# Altium schematic sheet MAIN.SchDoc
size 420 x 297 mm; SheetNumber: 1; SheetTotal: 3; SPICEModelCacheFXBRRBJG: <root> / <DocumentId>FXBRRBJG</DocumentId> / <CacheFrame Number="0"> / <Model Name="my_lib_c_rc" Kind="CKT"> / <Text>* MY_LIB YAGEO CC X7R: nominal capacitance, DFmax-derived Rs, minimum insulation. / * Source: YAGEO CC X7R March 6 2026 V.27 pp14-15,20. / * Rs=DFmax/(2*pi*1000*Cnom); Rins=min(1e10,K/Cnom). / * Constant Rs is justified at 1kHz only. Leakage adds a small extra AC loss. / * No tolerance, temperature, DC bias, ESL, aging, absorption or breakdown. / .SUBCKT MY_LIB_C_RC 1 2 PARAMS: Cvalue=1n Rsvalue=1 Rinsvalue=1e10 / Rloss 1 3 {Rsvalue} / Cmain 3 2 {Cvalue} / Rleak 1 2 {Rinsvalue} / .ENDS MY_LIB_C_RC</Text> / </Model> / </CacheFrame> / </root>
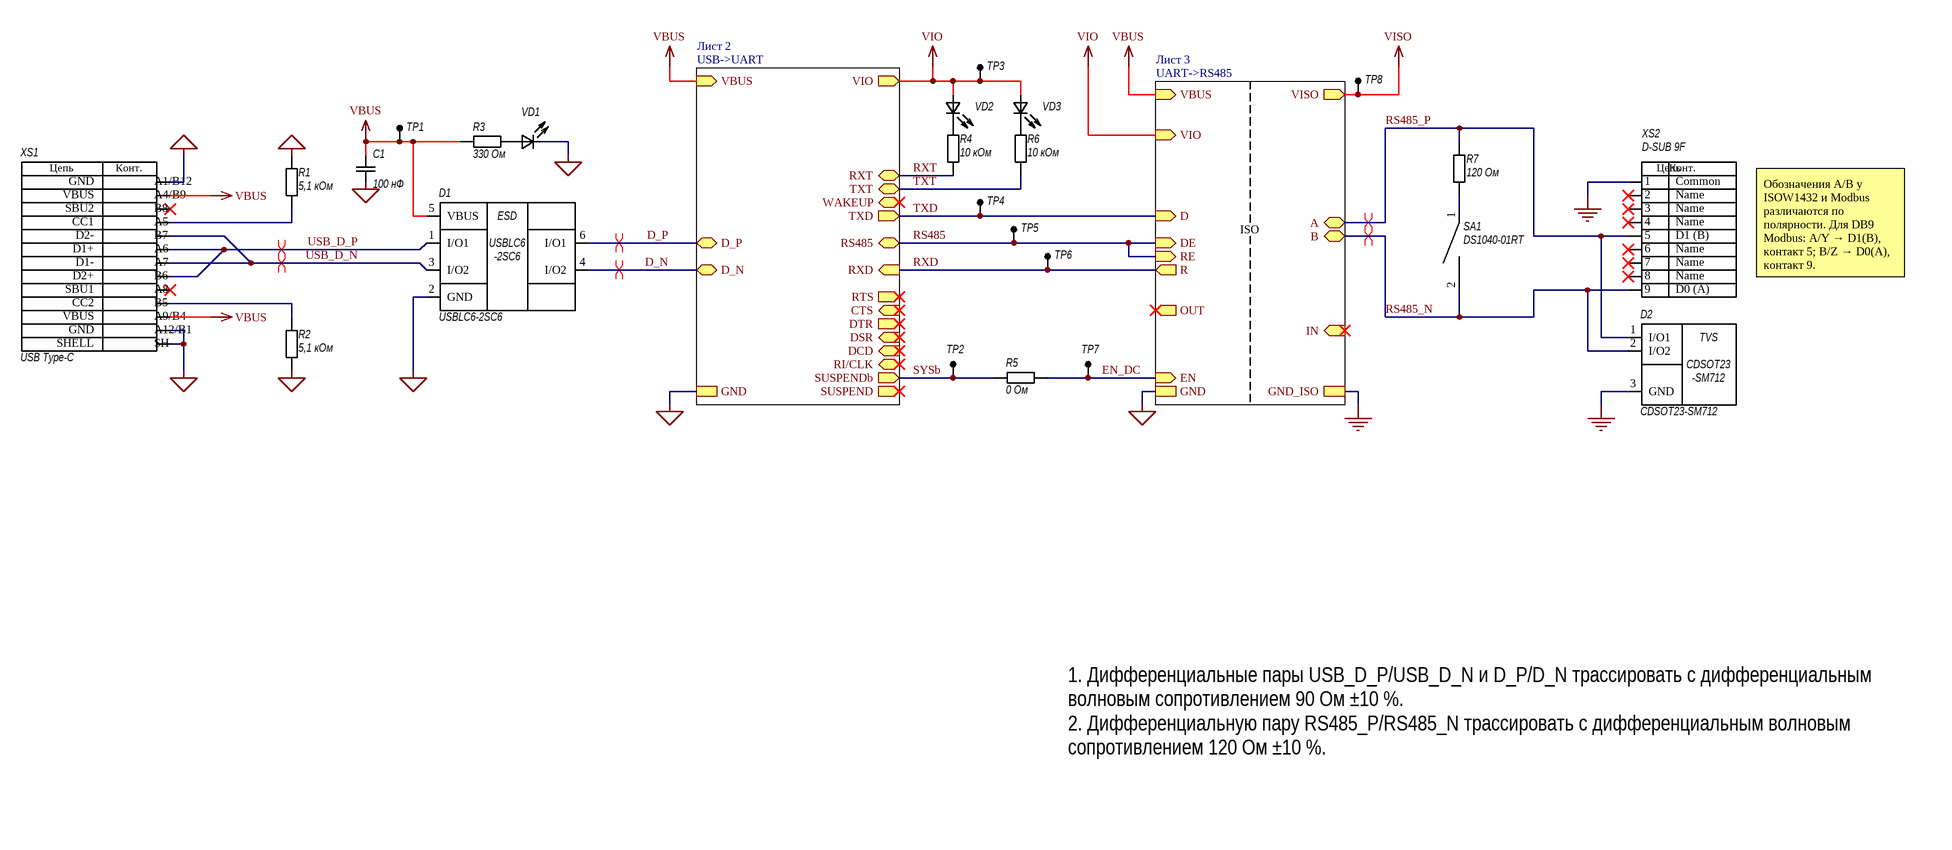
[diagram p0: MAIN.SchDoc]

## Parts
C1  100 нФ  [CAPC2012X135N]
D1  USBLC6-2SC6  [ST_SOT23-6L]
D2  CDSOT23-SM712  [BOURNS_CDSOT23_SM712]
R1  5,1 кОм  [RESC2012X70N]
R2  5,1 кОм  [RESC2012X70N]
R3  330 Ом  [RESC2012X70N]
R4  10 кОм  [RESC2012X70N]
R5  0 Ом  [RESC2012X70N]
R6  10 кОм  [RESC2012X70N]
R7  120 Ом  [RESC2012X70N]
SA1  DS1040-01RT  [CONNFLY_DS1040_01RT]
TP1  D1.5mm  [TestPoint_Pad_D1.5mm]  (value not drawn)  (no BOM)
TP2  D1.5mm  [TestPoint_Pad_D1.5mm]  (value not drawn)  (no BOM)
TP3  D1.5mm  [TestPoint_Pad_D1.5mm]  (value not drawn)  (no BOM)
TP4  D1.5mm  [TestPoint_Pad_D1.5mm]  (value not drawn)  (no BOM)
TP5  D1.5mm  [TestPoint_Pad_D1.5mm]  (value not drawn)  (no BOM)
TP6  D1.5mm  [TestPoint_Pad_D1.5mm]  (value not drawn)  (no BOM)
TP7  D1.5mm  [TestPoint_Pad_D1.5mm]  (value not drawn)  (no BOM)
TP8  D1.5mm  [TestPoint_Pad_D1.5mm]  (value not drawn)  (no BOM)
VD1  TO-2013BC-PG  [LED_OA2013_080_090_1C2A]  (value not drawn)
VD2  TO-2013BC-PG  [LED_OA2013_080_090_1C2A]  (value not drawn)
VD3  TO-2013BC-PG  [LED_OA2013_080_090_1C2A]  (value not drawn)
XS1  USB Type-C  PinA1_B12_Name: GND  PinA4_B9_Name: VBUS  PinB8_Name: SBU2  PinA5_Name: CC1  PinB7_Name: D2-  PinA6_Name: D1+  PinA7_Name: D1-  PinB6_Name: D2+  PinA8_Name: SBU1  PinB5_Name: CC2  PinSH_Name: SHELL  [USB4110-GF-A_GCT]
XS2  D-SUB 9F  Pin9_Name: D0 (A)  Pin8_Name: Name  Pin5_Name: D1 (B)  Pin1_Name: Common  [CONNFLY_DS1037_01_09F]

## Sub-sheets
U_USB_to_UART = UARTtoRS485.SchDoc: VBUS (in), GND, OUT (out), EN (in), IN (in), VISO (out), GND_ISO, A (bidir), B (bidir), D (in), DE (in), RE (in), R (out), VIO (in)  | Page: Лист 3; Name: UART->RS485
U_USBtoUART = USBtoUART.SchDoc: RXT (bidir), TXT (bidir), WAKEUP (bidir), RS485 (bidir), TXD (out), RXD (in), VBUS (in), GND, VIO (out), SUSPENDb (out), SUSPEND (out), RTS (out), CTS (in), DTR (out), DSR (in), DCD (in), RI/CLK (bidir), D_N (bidir), D_P (bidir)  | Page: Лист 2; Name: USB->UART

## Nets
GND: C1.1 D1.2(GND) R1.2 R2.1 VD1.1(C) XS1.A1/B12(GND) XS1.A12/B1(GND) XS1.SH(SHELL) ; sheet U_USBtoUART/GND, sheet U_USB_to_UART/GND
GND_ISO: D2.3(GND) XS2.1(Name) ; sheet U_USB_to_UART/GND_ISO
VBUS: C1.2 D1.5(VBUS) R3.1 TP1.1(TP) XS1.A4/B9(VBUS) XS1.A9/B4(VBUS) ; sheet U_USBtoUART/VBUS, sheet U_USB_to_UART/VBUS
VIO: TP3.1(TP) VD2.2(A) VD3.2(A) ; sheet U_USBtoUART/VIO, sheet U_USB_to_UART/VIO
VISO: TP8.1(TP) ; sheet U_USB_to_UART/VISO
D_N: D1.4(I/O2) ; sheet U_USBtoUART/D_N
D_P: D1.6(I/O1) ; sheet U_USBtoUART/D_P
EN_DC: R5.2 TP7.1(TP) ; sheet U_USB_to_UART/EN
RS485: TP5.1(TP) ; sheet U_USBtoUART/RS485, sheet U_USB_to_UART/DE, sheet U_USB_to_UART/RE
RS485_N: D2.2(I/O2) SA1.2 XS2.9(Name) ; sheet U_USB_to_UART/B
RS485_P: D2.1(I/O1) R7.2 XS2.5(Name) ; sheet U_USB_to_UART/A
RXD: TP6.1(TP) ; sheet U_USBtoUART/RXD, sheet U_USB_to_UART/R
RXT: R4.1 ; sheet U_USBtoUART/RXT
SYSb: R5.1 TP2.1(TP) ; sheet U_USBtoUART/SUSPENDb
TXD: TP4.1(TP) ; sheet U_USBtoUART/TXD, sheet U_USB_to_UART/D
TXT: R6.1 ; sheet U_USBtoUART/TXT
USB_D_N: D1.3(I/O2) XS1.A7(D-1) XS1.B7(D-2)
USB_D_P: D1.1(I/O1) XS1.A6(D+1) XS1.B6(D+2)
NetR1_1: R1.1 XS1.A5(CC1)
NetR2_2: R2.2 XS1.B5(CC2)
NetR3_2: R3.2 VD1.2(A)
NetR4_2: R4.2 VD2.1(C)
NetR6_2: R6.2 VD3.1(C)
NetR7_1: R7.1 SA1.1

Not connected (* = marked no-connect by the designer): XS1 A8(SBU1)* B8(SBU2)*; XS2 2(Name)* 3(Name)* 4(Name)* 6(Name)* 7(Name)* 8(Name)*

## Layout directives
differential pair: D_N, D_P, RS485_N, RS485_P, USB_D_N, USB_D_P

## Notes on the sheet
- ISO
- Обозначения A/B у ISOW1432 и Modbus различаются по полярности. Для DB9 Modbus: A/Y → D1(B), контакт 5; B/Z → D0(A), контакт 9.
- 1. Дифференциальные пары USB_D_P/USB_D_N и D_P/D_N трассировать с дифференциальным волновым сопротивлением 90 Ом ±10 %.
  2. Дифференциальную пару RS485_P/RS485_N трассировать с дифференциальным волновым сопротивлением 120 Ом ±10 %.
- Перв. примен.
- Справ. №
- Подп. дата
- Инв. № дубл.
- Взам. инв. №
- Подп. и дата
- Изм.
- Разраб.
- Лист
- № докум.
- Подп.
- Дата
- Лит.
- Масса
- Масштаб
- Пров.
- Т.контр.
- Листов
- Инв. № подл.
- Н.контр.
- Утв.
- ALTIUM GOSTBOM2.0 KEV
- Копировал
- Формат А3
- (in symbol U0003) ESD; USBLC6; -2SC6
- (in symbol U0005) TVS; CDSOT23; -SM712
- (in symbol XS0001) Цепь; Конт.
- (in symbol XS0002) Конт.; Цепь

## Library data of the parts
C1 = C0132: Конденсатор 100 нФ ±20% 100 В X7R 0805; Manufacturer: YAGEO; MPN: CC0805MKX7R0BB104; ID: C0132; Value: 100n; Voltage: 100 В; Notes: YAGEO CC; список 20.10.2026; CapacitanceNominalF: 1E-7; DissipationFactorMax: 0.025; DFTestFrequencyHz: 1000; DFTestVoltageVrms: 1; DFTestTemperatureC: 20; InsulationTimeConstantMinS: 500; InsulationResistanceMinOhm: 5000000000; InsulationTestVoltageV: 100; InsulationTestDurationS: 60; EquivalentSeriesResistanceOhm: 39.7887357729738; Type: Конденсатор; ESKD_value: 100 нФ; Tolerance: ±20%; Package: 0805; CommentBase: Конденсатор 100 нФ ±20% 100 В X7R 0805; Dielectric: X7R; ComponentLink2URL: https://yageogroup.com/content/datasheet/asset/file/UPY-GPHC_X7R_6_3V-TO-250V; ComponentLink2Description: Даташит — производитель; HelpURL: C:\Users\Nomatin\Documents\Altium\MY_LIB\MY_LIB\Datasheets\YAGEO_CC_X7R.pdf; ComponentLink1URL: C:\Users\Nomatin\Documents\Altium\MY_LIB\MY_LIB\Datasheets\YAGEO_CC_X7R.pdf; ComponentLink1Description: Даташит — локальный; Datasheet: C:\Users\Nomatin\Documents\Altium\MY_LIB\MY_LIB\Datasheets\YAGEO_CC_X7R.pdf
D1 = U0003: Микросхема USBLC6-2SC6; Manufacturer: STMicroelectronics; ID: U0003; Voltage: 5.25 V (VRM); Notes: ESD-защита двух линий USB. Tj −40…+150 °C (не TA), табл. 1 absolute ratings. I/O1=1,6; I/O2=3,4; GND=2; VBUS=5.; TemperatureReference: Tj (junction), °C; Table 1 absolute ratings; JunctionTemperatureMin: -40; JunctionTemperatureMax: 150; Type: Микросхема; Value: USBLC6-2SC6; ESKD_value: USBLC6-2SC6; Package: SOT23-6L; MPN: USBLC6-2SC6; CommentBase: Микросхема USBLC6-2SC6; OperatingTemperatureMin: -40; OperatingTemperatureMax: 150; StorageTemperatureMin: -55; StorageTemperatureMax: 150; Datasheet: C:\Users\Nomatin\Documents\Altium\MY_LIB\MY_LIB\Datasheets\USBLC6-2_ST.pdf; DatasheetRevision: DS4260 Rev 7, December 2021; ComponentLink1Description: Даташит — локальный; ComponentLink1URL: C:\Users\Nomatin\Documents\Altium\MY_LIB\MY_LIB\Datasheets\USBLC6-2_ST.pdf; ComponentLink2URL: https://www.st.com/resource/en/datasheet/usblc6-2.pdf; ComponentLink2Description: Даташит — производитель; HelpURL: C:\Users\Nomatin\Documents\Altium\MY_LIB\MY_LIB\Datasheets\USBLC6-2_ST.pdf
D2 = U0005: TVS-сборка CDSOT23-SM712; Manufacturer: Bourns; ID: U0005; Power: 400 Вт (импульс 8/20 мкс); Voltage: VWM: 7/12 В (по полярности); Notes: RS-485 TVS: 1=I/O1, 2=I/O2, 3=GND. VWM: 3→1/2 — 7 В; 1/2→3 — 12 В. IPP 17 А, 8/20 мкс.; TemperatureReference: TOPR, °C; datasheet absolute ratings; Type: TVS-сборка; Value: CDSOT23-SM712; ESKD_value: CDSOT23-SM712; Package: SOT23-3; MPN: CDSOT23-SM712; CommentBase: TVS-сборка CDSOT23-SM712; OperatingTemperatureMin: -55; OperatingTemperatureMax: 150; StorageTemperatureMin: -55; StorageTemperatureMax: 150; Datasheet: C:\Users\Nomatin\Documents\Altium\MY_LIB\MY_LIB\Datasheets\CDSOT23-SM712_Bourns.pdf; DatasheetRevision: Rev. 06/24; ComponentLink1Description: Даташит — локальный; ComponentLink1URL: C:\Users\Nomatin\Documents\Altium\MY_LIB\MY_LIB\Datasheets\CDSOT23-SM712_Bourns.pdf; ComponentLink2Description: Даташит — производитель; ComponentLink2URL: https://www.bourns.com/docs/product-datasheets/cdsot23-sm712.pdf; HelpURL: C:\Users\Nomatin\Documents\Altium\MY_LIB\MY_LIB\Datasheets\CDSOT23-SM712_Bourns.pdf
R1 R2 = R0243: Резистор 5,1 кОм ±5% 0805; Manufacturer: YAGEO; MPN: RC0805JR-075K1L; ID: R0243; Value: 5.1k; Power: 0,125 Вт; Voltage: 150 В макс.; Notes: RC_L; E24; P при 70 °C; SPICE: +100 ppm/°C при 25 °C — положительная граница ±100, не измеренный ТКС (RC_L, табл.2/5, стр.5/8).; TCR: ±100 ppm/°C; Type: Резистор; ESKD_value: 5,1 кОм; Tolerance: ±5%; Package: 0805; CommentBase: Резистор 5,1 кОм ±5% 0805; ComponentLink2URL: https://yageogroup.com/content/datasheet/asset/file/PYU-RC_GROUP_51_ROHS_L; ComponentLink2Description: Даташит — производитель; HelpURL: C:\Users\Nomatin\Documents\Altium\MY_LIB\MY_LIB\Datasheets\YAGEO_RC_L.pdf; ComponentLink1URL: C:\Users\Nomatin\Documents\Altium\MY_LIB\MY_LIB\Datasheets\YAGEO_RC_L.pdf; ComponentLink1Description: Даташит — локальный; Datasheet: C:\Users\Nomatin\Documents\Altium\MY_LIB\MY_LIB\Datasheets\YAGEO_RC_L.pdf
R3 = R0214: Резистор 330 Ом ±5% 0805; Manufacturer: YAGEO; MPN: RC0805JR-07330RL; ID: R0214; Value: 330R; Power: 0,125 Вт; Voltage: 150 В макс.; Notes: RC_L; E24; P при 70 °C; SPICE: +100 ppm/°C при 25 °C — положительная граница ±100, не измеренный ТКС (RC_L, табл.2/5, стр.5/8).; TCR: ±100 ppm/°C; Type: Резистор; ESKD_value: 330 Ом; Tolerance: ±5%; Package: 0805; CommentBase: Резистор 330 Ом ±5% 0805; Datasheet: C:\Users\Nomatin\Documents\Altium\MY_LIB\MY_LIB\Datasheets\YAGEO_RC_L.pdf; ComponentLink1Description: Даташит — локальный; ComponentLink1URL: C:\Users\Nomatin\Documents\Altium\MY_LIB\MY_LIB\Datasheets\YAGEO_RC_L.pdf; ComponentLink2Description: Даташит — производитель; ComponentLink2URL: https://yageogroup.com/content/datasheet/asset/file/PYU-RC_GROUP_51_ROHS_L; HelpURL: C:\Users\Nomatin\Documents\Altium\MY_LIB\MY_LIB\Datasheets\YAGEO_RC_L.pdf
R4 R6 = R0250: Резистор 10 кОм ±5% 0805; Manufacturer: YAGEO; MPN: RC0805JR-0710KL; ID: R0250; Value: 10k; Power: 0,125 Вт; Voltage: 150 В макс.; Notes: RC_L; E24; P при 70 °C; SPICE: +100 ppm/°C при 25 °C — положительная граница ±100, не измеренный ТКС (RC_L, табл.2/5, стр.5/8).; TCR: ±100 ppm/°C; Type: Резистор; ESKD_value: 10 кОм; Tolerance: ±5%; Package: 0805; CommentBase: Резистор 10 кОм ±5% 0805; ComponentLink2URL: https://yageogroup.com/content/datasheet/asset/file/PYU-RC_GROUP_51_ROHS_L; ComponentLink2Description: Даташит — производитель; HelpURL: C:\Users\Nomatin\Documents\Altium\MY_LIB\MY_LIB\Datasheets\YAGEO_RC_L.pdf; ComponentLink1URL: C:\Users\Nomatin\Documents\Altium\MY_LIB\MY_LIB\Datasheets\YAGEO_RC_L.pdf; ComponentLink1Description: Даташит — локальный; Datasheet: C:\Users\Nomatin\Documents\Altium\MY_LIB\MY_LIB\Datasheets\YAGEO_RC_L.pdf
R5 = R0005: Резистор 0 Ом 0805; Manufacturer: YAGEO; MPN: RC0805JR-070RL; ID: R0005; Value: 0R; Power: 0,125 Вт; Notes: Перемычка RC_L; R < 50 мОм; номинальный ток 2 А; J — код заказа перемычки, процентный допуск не применяется. Источник: https://www.yageogroup.com/content/datasheet/asset/file/PYU-RC_GROUP_51_ROHS_L; SPICE: ТКС перемычек не указан в RC_L; R=0,05 Ом сохранено, температурная зависимость не моделируется.; TCR: Не указан; Type: Резистор; ESKD_value: 0 Ом; Package: 0805; CommentBase: Резистор 0 Ом 0805; ComponentLink2URL: https://yageogroup.com/content/datasheet/asset/file/PYU-RC_GROUP_51_ROHS_L; ComponentLink2Description: Даташит — производитель; HelpURL: C:\Users\Nomatin\Documents\Altium\MY_LIB\MY_LIB\Datasheets\YAGEO_RC_L.pdf; ComponentLink1URL: C:\Users\Nomatin\Documents\Altium\MY_LIB\MY_LIB\Datasheets\YAGEO_RC_L.pdf; ComponentLink1Description: Даташит — локальный; Datasheet: C:\Users\Nomatin\Documents\Altium\MY_LIB\MY_LIB\Datasheets\YAGEO_RC_L.pdf
R7 = R0204: Резистор 120 Ом ±5% 0805; Manufacturer: YAGEO; MPN: RC0805JR-07120RL; ID: R0204; Value: 120R; Power: 0,125 Вт; Voltage: 150 В макс.; Notes: RC_L; E24; P при 70 °C; SPICE: +100 ppm/°C при 25 °C — положительная граница ±100, не измеренный ТКС (RC_L, табл.2/5, стр.5/8).; TCR: ±100 ppm/°C; Type: Резистор; ESKD_value: 120 Ом; Tolerance: ±5%; Package: 0805; CommentBase: Резистор 120 Ом ±5% 0805; ComponentLink2URL: https://yageogroup.com/content/datasheet/asset/file/PYU-RC_GROUP_51_ROHS_L; ComponentLink2Description: Даташит — производитель; HelpURL: C:\Users\Nomatin\Documents\Altium\MY_LIB\MY_LIB\Datasheets\YAGEO_RC_L.pdf; ComponentLink1URL: C:\Users\Nomatin\Documents\Altium\MY_LIB\MY_LIB\Datasheets\YAGEO_RC_L.pdf; ComponentLink1Description: Даташит — локальный; Datasheet: C:\Users\Nomatin\Documents\Altium\MY_LIB\MY_LIB\Datasheets\YAGEO_RC_L.pdf
SA1 = SA0001: Переключатель DS1040-01RT; Manufacturer: CONNFLY; ID: SA0001; Voltage: 24 В AC/DC; Notes: 1 позиция SPST Piano; красный корпус. 3D-модель приблизительная: см. REVIEW.md в папке footprint.; CurrentRating: 100 мА; TemperatureReference: Temperature Range, °C; DS1040 sheet 3; ContactForm: SPST; Positions: 1; MPN: DS1040-01RT; Datasheet: C:\Users\Nomatin\Documents\Altium\MY_LIB\MY_LIB\Datasheets\CONNFLY_DS1040_series.pdf; Type: Переключатель; Value: DS1040-01RT; ESKD_value: DS1040-01RT; Package: Piano DIP, THT, 2 вывода; CommentBase: Переключатель DS1040-01RT; DatasheetRevision: C-DS1040-01XT-E, Rev. E, 05.07.2019; ComponentLink1Description: Даташит — локальный; ComponentLink1URL: C:\Users\Nomatin\Documents\Altium\MY_LIB\MY_LIB\Datasheets\CONNFLY_DS1040_series.pdf; OperatingTemperatureMin: -40; OperatingTemperatureMax: 105; ComponentLink2URL: https://www.connfly.com/static/upload/file/pdf/DS1040.pdf; ComponentLink2Description: Даташит — производитель; HelpURL: C:\Users\Nomatin\Documents\Altium\MY_LIB\MY_LIB\Datasheets\CONNFLY_DS1040_series.pdf
TP1-TP8 = TP0002: Контрольная точка Площадка Ø1,5 мм; ID: TP0002; Notes: Одна круглая площадка Top Layer; маска открыта +0,05 мм; без отверстия, пасты и шелкографии. Standard (No BOM).; DiameterMm: 1.5; Standard: GOST 2.721-74, Table 6a, item 7; Type: Контрольная точка; Value: D1.5mm; ESKD_value: D1.5mm; Package: Площадка Ø1,5 мм; CommentBase: Контрольная точка Площадка Ø1,5 мм; ComponentType: Standard (No BOM)
VD1-VD3 = HL0009: Светодиод Чистый зелёный 3,2В 705мкд 0805; Manufacturer: Oasistek; ID: HL0009; Voltage: 3,2 В (тип., IF=20 мА); Notes: VF/IV: каталог 2021, IF=20 мА. Площадки по даташиту: 0,80×1,20; зазор 0,90 мм. 1=K, 2=A. Типовая 3D, не точный CAD Oasistek.; WavelengthNm: 525; ForwardVoltageTypicalV: 3.2; ForwardVoltageMaxV: 3.6; TestCurrentMa: 20; ViewingAngleDeg: 120; IntensityMinMcd: 321; IntensityTypicalMcd: 705; PinMapping: 1=C (K), 2=A; ChipMaterial: InGaN; LED_IS: 8.21368101376E-51; LED_N: 1; LED_RS: 13.4860774673; Type: Светодиод; Value: TO-2013BC-PG; ESKD_value: TO-2013BC-PG; Package: 0805; MPN: TO-2013BC-PG; CommentBase: Светодиод Чистый зелёный 3,2В 705мкд 0805; Datasheet: C:\Users\Nomatin\Documents\Altium\MY_LIB\MY_LIB\Datasheets\Oasistek_LED\TO-2013BC-PG.pdf; DatasheetRevision: Параметры: каталог 2021, стр.19–20; пины: Rev. A-1; 2017-06-09; GS1706012; ComponentLink1Description: Даташит — локальный; ComponentLink1URL: C:\Users\Nomatin\Documents\Altium\MY_LIB\MY_LIB\Datasheets\Oasistek_LED\TO-2013BC-PG.pdf; Color: Чистый зелёный; Family: TO-2013BC; ComponentLink2Description: Даташит — производитель; ComponentLink2URL: https://www.oasistek.com/upload/2021_SMD_Lamp_Catalogue.pdf; HelpURL: C:\Users\Nomatin\Documents\Altium\MY_LIB\MY_LIB\Datasheets\Oasistek_LED\TO-2013BC-PG.pdf
XS1 = XS0001: Разъём USB Type-C USB4110-GF-A; Manufacturer: GCT; ID: XS0001; Notes: USB 2.0; 12 сигнальных выводов + SH; 4 площадки корпуса SH; Value: USB Type-C; MPN: USB4110-GF-A; Datasheet: C:\Users\Nomatin\Documents\Altium\MY_LIB\MY_LIB\Datasheets\GCT_USB4110\USB4110_drawing.pdf; PinA9_B4_Name: VBUS; PinA12_B1_Name: GND; Type: Разъём; ESKD_value: USB Type-C; Package: USB Type-C, SMT; CommentBase: Разъём USB Type-C USB4110-GF-A; DatasheetRevision: B4, 22.05.2024; ComponentLink1Description: Даташит — локальный; ComponentLink1URL: C:\Users\Nomatin\Documents\Altium\MY_LIB\MY_LIB\Datasheets\GCT_USB4110\USB4110_drawing.pdf; ComponentLink2URL: https://gct.co/files/drawings/usb4110.pdf; ComponentLink2Description: Даташит — производитель; HelpURL: C:\Users\Nomatin\Documents\Altium\MY_LIB\MY_LIB\Datasheets\GCT_USB4110\USB4110_drawing.pdf
XS2 = XS0002: Разъём D-SUB 9F DS1037-01-09F; Manufacturer: CONNFLY; ID: XS0002; Notes: Контакты 1–9. Два крепления NPTH без электрического подключения. STEP пользователя встроен. См. REVIEW.md.; Value: D-SUB 9F; Pin7_Name: Name; Pin6_Name: Name; Pin4_Name: Name; Pin3_Name: Name; Pin2_Name: Name; Type: Разъём; ESKD_value: D-SUB 9F; Package: D-SUB-9, угловая розетка, THT; MPN: DS1037-01-09F; CommentBase: Разъём D-SUB 9F DS1037-01-09F; Datasheet: C:\Users\Nomatin\Documents\Altium\MY_LIB\MY_LIB\Datasheets\CONNFLY_DS1037-01.pdf; DatasheetRevision: C, 08.08.2017; ComponentLink1Description: Даташит — локальный; ComponentLink1URL: C:\Users\Nomatin\Documents\Altium\MY_LIB\MY_LIB\Datasheets\CONNFLY_DS1037-01.pdf; ComponentLink2URL: https://www.connfly.com/static/upload/file/pdf/DS1037-01.pdf; ComponentLink2Description: Даташит — производитель; HelpURL: C:\Users\Nomatin\Documents\Altium\MY_LIB\MY_LIB\Datasheets\CONNFLY_DS1037-01.pdf